# Altium schematic sheet ClayCounterCircuit-V2.0.SchDoc: Clay Counter V2
size 223 x 172 mm; DrawnBy: Jaxon Fowler; Revision: 2; SheetNumber: 1; SheetTotal: 1; ENG_APP_DATE: --/--/--; DSN_APP_DATE: --/--/--; CHK_APP_DATE: --/--/--
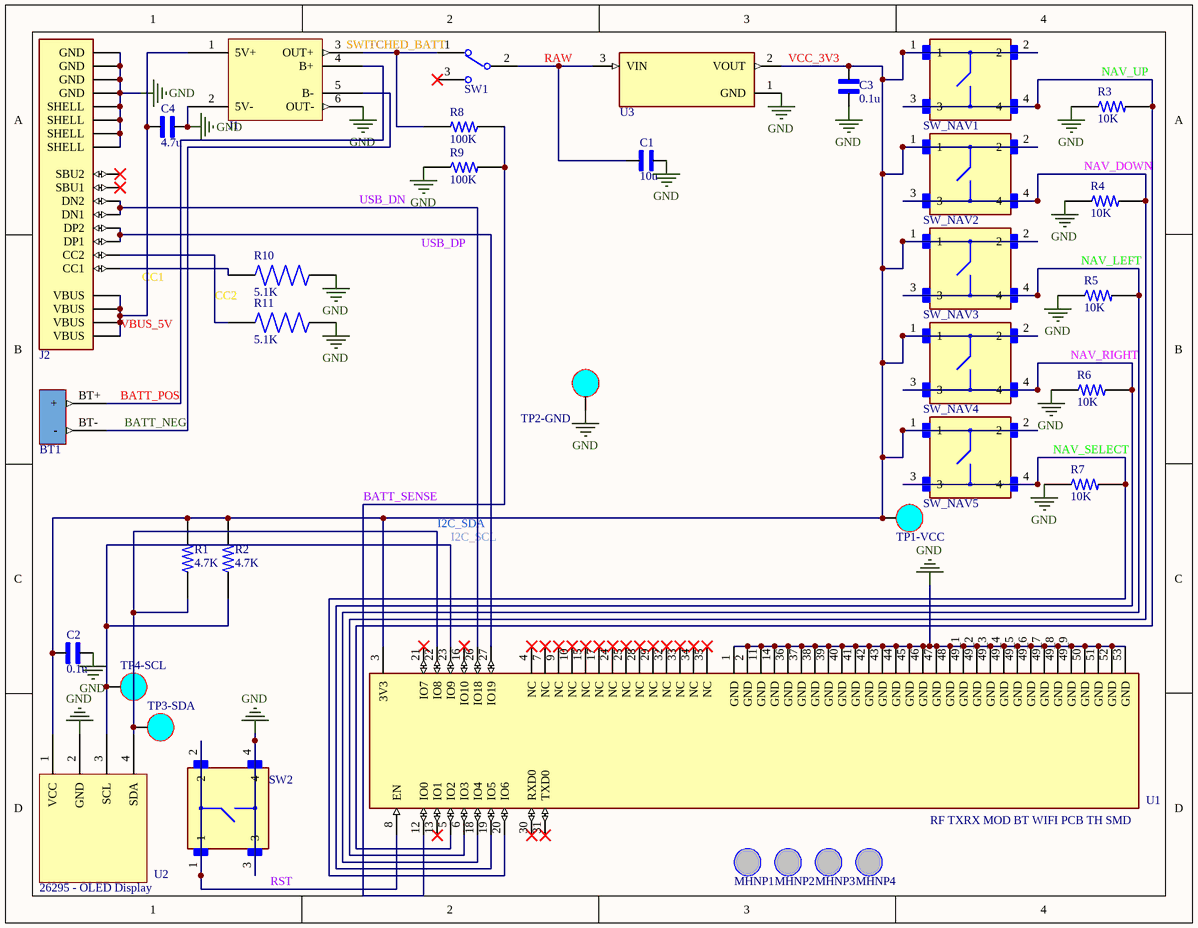
[diagram p0: ClayCounterCircuit-V2.0.SchDoc]

## Parts
BT1  BATTERY LITH-ION 3.7V 2.2AH 1865  [1781 Two Pad]  (value not drawn)
C1  value 10u  [CAPC1608X90]  (hidden comment: CAP CER 10UF 16V X5R 0603)
C2  value 0.1u  [CAPC1608X90]  (hidden comment: CAP CER 0.1UF 16V X7R 0603)
C3  value 0.1u  [CAPC1608X90]  (hidden comment: CAP CER 0.1UF 16V X7R 0603)
C4  value 4.7u  [CAPC1608X90]  (hidden comment: CAP SMD,0603,X5R,4.7UF,10%,16V)
J1  TP4056 Module for 18650 Li-Po Charging  [TP4056]  (value not drawn)
J2  CONN RCPT USB2.0 TYPE C 16+8POS  [GCT_USB4085-GF-A_REVA4]  (value not drawn)
MHNP1  Mounting Hole Non-Plated 3.2mm  [MTHNP-3.2mm]  (value not drawn)
MHNP2  Mounting Hole Non-Plated 3.2mm  [MTHNP-3.2mm]  (value not drawn)
MHNP3  Mounting Hole Non-Plated 3.2mm  [MTHNP-3.2mm]  (value not drawn)
MHNP4  Mounting Hole Non-Plated 3.2mm  [MTHNP-3.2mm]  (value not drawn)
R1  value 4.7K  [RESC1607X60N]  (hidden comment: RES 4.7K OHM 1% 1/10W 0603)
R2  value 4.7K  [RESC1607X60N]  (hidden comment: RES 4.7K OHM 1% 1/10W 0603)
R3  value 10K  [RESC1607X60N]  (hidden comment: RES 10K OHM 1% 1/10W 0603)
R4  value 10K  [RESC1607X60N]  (hidden comment: RES 10K OHM 1% 1/10W 0603)
R5  value 10K  [RESC1607X60N]  (hidden comment: RES 10K OHM 1% 1/10W 0603)
R6  value 10K  [RESC1607X60N]  (hidden comment: RES 10K OHM 1% 1/10W 0603)
R7  value 10K  [RESC1607X60N]  (hidden comment: RES 10K OHM 1% 1/10W 0603)
R8  value 100K  [RESC1607X60N]  (hidden comment: RES 100K OHM 1% 1/10W 0603)
R9  value 100K  [RESC1607X60N]  (hidden comment: RES 100K OHM 1% 1/10W 0603)
R10  value 5.1K  [RESC1607X60N]  (hidden comment: RES 5.1K OHM 1% 1/10W 0603)
R11  value 5.1K  [RESC1607X60N]  (hidden comment: RES 5.1K OHM 1% 1/10W 0603)
SW1  SWITCH SLIDE SPDT 300MA 6V  [SW_JS102011SAQN]  (value not drawn)
SW2  SWITCH TACTILE SPST-NO 0.05A 24V  [SW_B3F-1000]  (value not drawn)
SW_NAV1  SWITCH TACTILE SPST-NO 0.05A 24V  [SW_B3F-1000]  (value not drawn)
SW_NAV2  SWITCH TACTILE SPST-NO 0.05A 24V  [SW_B3F-1000]  (value not drawn)
SW_NAV3  SWITCH TACTILE SPST-NO 0.05A 24V  [SW_B3F-1000]  (value not drawn)
SW_NAV4  SWITCH TACTILE SPST-NO 0.05A 24V  [SW_B3F-1000]  (value not drawn)
SW_NAV5  SWITCH TACTILE SPST-NO 0.05A 24V  [SW_B3F-1000]  (value not drawn)
TP1-VCC  Test Point  [TestPoint]  (value not drawn)
TP2-GND  Test Point  [TestPoint]  (value not drawn)
TP3-SDA  Test Point  [TestPoint]  (value not drawn)
TP4-SCL  Test Point  [TestPoint]  (value not drawn)
U1  RF TXRX MOD BT WIFI PCB TH SMD  [XCVR_ESP32-C3-MINI-1-N4]
U2  GRAPHIC DISPLAY OLED WHITE 1.3"  [4 Pin Header TH - 2.54mm]  (value not drawn)
U3  IC REG LINEAR 3.3V 250MA SOT23-3  [SOT95P237X112-3N]  (value not drawn)

## Nets
GND: C1.1 C2.2 C3.1 C4.1 J1.2(5V-) J1.6(OUT-) J2.A1(GND) J2.A12(GND) J2.B1(GND) J2.B12(GND) J2.S1(SHELL) J2.S2(SHELL) J2.S3(SHELL) J2.S4(SHELL) R3.1 R4.1 R5.1 R6.1 R7.1 R9.1 R10.2 R11.2 SW2.3 SW2.4 TP2-GND.TP U1.1(GND) U1.2(GND) U1.11(GND) U1.14(GND) U1.36(GND) U1.37(GND) U1.38(GND) U1.39(GND) U1.40(GND) U1.41(GND) U1.42(GND) U1.43(GND) U1.44(GND) U1.45(GND) U1.46(GND) U1.47(GND) U1.48(GND) U1.49_1(GND) U1.49_2(GND) U1.49_3(GND) U1.49_4(GND) U1.49_5(GND) U1.49_6(GND) U1.49_7(GND) U1.49_8(GND) U1.49_9(GND) U1.50(GND) U1.51(GND) U1.52(GND) U1.53(GND) U2.2(GND) U3.1(GND)
BATT_NEG: BT1.BT-(-) J1.5(B-)
BATT_POS: BT1.BT+(+) J1.4(B+)
BATT_SENSE: R8.1 R9.2 U1.12(IO0)
CC1: J2.A5(CC1) R10.1
CC2: J2.B5(CC2) R11.1
I2C_SCL: R2.1 TP4-SCL.TP U1.23(IO9) U2.3(SCL)
I2C_SDA: R1.1 TP3-SDA.TP U1.22(IO8) U2.4(SDA)
NAV_DOWN: R4.2 SW_NAV2.3 SW_NAV2.4 U1.6(IO3)
NAV_LEFT: R5.2 SW_NAV3.3 SW_NAV3.4 U1.18(IO4)
NAV_RIGHT: R6.2 SW_NAV4.3 SW_NAV4.4 U1.19(IO5)
NAV_SELECT: R7.2 SW_NAV5.3 SW_NAV5.4 U1.20(IO6)
NAV_UP: R3.2 SW_NAV1.3 SW_NAV1.4 U1.5(IO2)
RAW: C1.2 SW1.2 U3.3(VIN)
RST: SW2.1 SW2.2 U1.8(EN)
SWITCHED_BATT: J1.3(OUT+) R8.2 SW1.1
USB_DN: J2.A7(DN1) J2.B7(DN2) U1.26(IO18)
USB_DP: J2.A6(DP1) J2.B6(DP2) U1.27(IO19)
VBUS_5V: C4.2 J1.1(5V+) J2.A4(VBUS) J2.A9(VBUS) J2.B4(VBUS) J2.B9(VBUS)
VCC_3V3: C2.1 C3.2 R1.2 R2.2 SW_NAV1.1 SW_NAV1.2 SW_NAV2.1 SW_NAV2.2 SW_NAV3.1 SW_NAV3.2 SW_NAV4.1 SW_NAV4.2 SW_NAV5.1 SW_NAV5.2 TP1-VCC.TP U1.3(3V3) U2.1(VCC) U3.2(VOUT)

Not connected (* = marked no-connect by the designer): J2 A8(SBU1)* B8(SBU2)*; SW1 3*; U1 4(NC)* 7(NC)* 9(NC)* 10(NC)* 13(IO1)* 15(NC)* 16(IO10)* 17(NC)* 21(IO7)* 24(NC)* 25(NC)* 28(NC)* 29(NC)* 30(RXD0)* 31(TXD0)* 32(NC)* 33(NC)* 34(NC)* 35(NC)*

## Notes on the sheet
- (in symbol 26295) 26295 - OLED Display

## Library data of the parts
BT1 = 1781: 18650 3.7 V Lithium-Ion Battery Rechargeable (Secondary) 2.2Ah; Supplier 1: DigiKey; Supplier Part Number 1: 1528-1836-ND
C1 = CC0603KRX5R7BB106: 10 µF ±10% 16V Ceramic Capacitor X5R 0603 (1608 Metric); MF: KEMET; MP: C0603C104J4RACTU; SnapEDA_Link: https://www.snapeda.com/parts/C0603C104J4RACTU/KEMET/view-part/?ref=snap; Package: 603-2 KEMET; Check_prices: https://www.snapeda.com/parts/C0603C104J4RACTU/KEMET/view-part/?ref=eda; Supplier 1: DigiKey; Supplier Part Number 1: 311-3486-1-ND
C2 C3 = C0603C104J4RACTU: 0.1 µF ±5% 16V Ceramic Capacitor X7R 0603 (1608 Metric); MF: KEMET; SnapEDA_Link: https://www.snapeda.com/parts/C0603C104J4RACTU/KEMET/view-part/?ref=snap; Package: 603-2 KEMET; MP: C0603C104J4RACTU; Check_prices: https://www.snapeda.com/parts/C0603C104J4RACTU/KEMET/view-part/?ref=eda; Supplier 1: DigiKey; Supplier Part Number 1: 399-C0603C104J4RACTUCT-ND
C4 = 0603W475K160XD: 4.7 µF ±10% 16V Ceramic Capacitor X5R 0603 (1608 Metric)
J1 = TP4056 Mod: HiLetgo TP4056 Type-c USB 5V 1A 18650 Lithium Battery Charger Module Charging Board with Dual Protection Functions
J2 = USB4085-GF-A: USB-C (USB TYPE-C) USB 2.0 Receptacle Connector 24 (16+8 Dummy) Position Through Hole, Right Angle; MF: Global Connector Technology; SnapEDA_Link: https://www.snapeda.com/parts/USB4085-GF-A/Global+Connector+Technology/view-part/?ref=snap; Package: None; MP: USB4085-GF-A; Check_prices: https://www.snapeda.com/parts/USB4085-GF-A/Global+Connector+Technology/view-part/?ref=eda; Purchase-URL: https://pricing.snapeda.com/search/part/USB4085-GF-A/?ref=eda; Price: None; Value: *; Availability: In Stock; Supplier 1: DigiKey; Supplier Part Number 1: 2073-USB4085-GF-ACT-ND
MHNP1-MHNP4 = MTHNP-3.2mm
R1 R2 = RC0603FR-074K7L: 4.7 kOhms ±1% 0.1W, 1/10W Chip Resistor 0603 (1608 Metric) Moisture Resistant Thick Film; MF: Yageo Corporation; MP: RC0603FR074K7L; SnapEDA_Link: https://www.snapeda.com/parts/RC0603FR074K7L/Yageo/view-part/?ref=snap; Package: 0603-2 YAGEO; Check_prices: https://www.snapeda.com/parts/RC0603FR074K7L/Yageo/view-part/?ref=eda; Supplier 1: DigiKey; Supplier Part Number 1: 311-4.70KHRCT-ND
R3-R7 = RC0603FR-0710KL: 10 kOhms ±1% 0.1W, 1/10W Chip Resistor 0603 (1608 Metric) Moisture Resistant Thick Film; MF: Yageo; SnapEDA_Link: https://www.snapeda.com/parts/RC0603FR-0710KL/Yageo/view-part/?ref=snap; Package: 0603 Yageo; MP: RC0603FR-0710KL; Check_prices: https://www.snapeda.com/parts/RC0603FR-0710KL/Yageo/view-part/?ref=eda; Supplier 1: DigiKey; Supplier Part Number 1: 311-10.0KHRCT-ND
R8 R9 = RC0603FR-07100KL: 100 kOhms ±1% 0.1W, 1/10W Chip Resistor 0603 (1608 Metric) Moisture Resistant Thick Film; MF: Yageo; SnapEDA_Link: https://www.snapeda.com/parts/RC0603FR-07100KL/Yageo/view-part/?ref=snap; Package: 0603 Yageo; MP: RC0603FR-07100KL; Check_prices: https://www.snapeda.com/parts/RC0603FR-07100KL/Yageo/view-part/?ref=eda; Supplier 1: DigiKey; Supplier Part Number 1: 311-100KHRCT-ND
R10 R11 = RC0603FR-075K1L: 5.1 kOhms ±1% 0.1W, 1/10W Chip Resistor 0603 (1608 Metric) Moisture Resistant Thick Film; MF: Yageo; SnapEDA_Link: https://www.snapeda.com/parts/RC0603FR-075K1L/Yageo/view-part/?ref=snap; Package: 0603 Yageo; MP: RC0603FR-075K1L; Check_prices: https://www.snapeda.com/parts/RC0603FR-075K1L/Yageo/view-part/?ref=eda; Supplier 1: DigiKey; Supplier Part Number 1: 311-5.10KHRCT-ND
SW1 = JS102011SAQN: Slide Switch SPDT Surface Mount, Right Angle; MF: C&K; Check_prices: https://www.snapeda.com/parts/JS102011SAQN/C%2526K/view-part/?ref=eda; Digi-Key_Part_Number: 401-1999-2-ND; Package: None; MP: JS102011SAQN; Value: *; SnapEDA_Link: https://www.snapeda.com/parts/JS102011SAQN/C%2526K/view-part/?ref=snap; Purchase-URL: https://pricing.snapeda.com/search/part/JS102011SAQN/?ref=eda
SW2 SW_NAV1-SW_NAV5 = B3F-1000: Tactile Switch SPST-NO Top Actuated Through Hole; MF: Omron; Price: None; Check_prices: https://www.snapeda.com/parts/B3F-1000/Omron+Electronics+Inc-EMC+Div/view-part/?ref=eda; Purchase-URL: https://pricing.snapeda.com/search/part/B3F-1000/?ref=eda; Value: *; Package: None; Availability: In Stock; MP: B3F-1000; SnapEDA_Link: https://www.snapeda.com/parts/B3F-1000/Omron+Electronics+Inc-EMC+Div/view-part/?ref=snap; Supplier 1: DigiKey; Supplier Part Number 1: SW400-ND
U1 = ESP32-C3-MINI-1-N4: Bluetooth, WiFi 802.11b/g/n, Bluetooth v5.0 Transceiver Module 2.412GHz ~ 2.484GHz PCB Trace Surface Mount; MF: {'manufacturer': u'Espressif Systems'}; Package: None; Price: None; Value: *; MP: ESP32-C3-MINI-1-N4; Availability: Unavailable; Supplier 1: DigiKey; Supplier Part Number 1: 5407-ESP32-C3-MINI-1-N4CT-ND
U2 = 26295: Non-Touch Graphic LCD Display Module Transmissive White OLED, Monochrome I2C 1.3" (33.02mm) 128 x 64
U3 = MCP1700T-3302E/TT: Linear Voltage Regulator IC Positive Fixed 1 Output 250mA SOT-23-3; MF: Microchip; SnapEDA_Link: https://www.snapeda.com/parts/MCP1700T-3302E/TT/Microchip/view-part/?ref=snap; Package: SOT-23 Microchip; Value: *; MP: MCP1700T-3302E/TT; Check_prices: https://www.snapeda.com/parts/MCP1700T-3302E/TT/Microchip/view-part/?ref=eda; Supplier 1: DigiKey; Supplier Part Number 1: MCP1700T3302ETTCT-ND